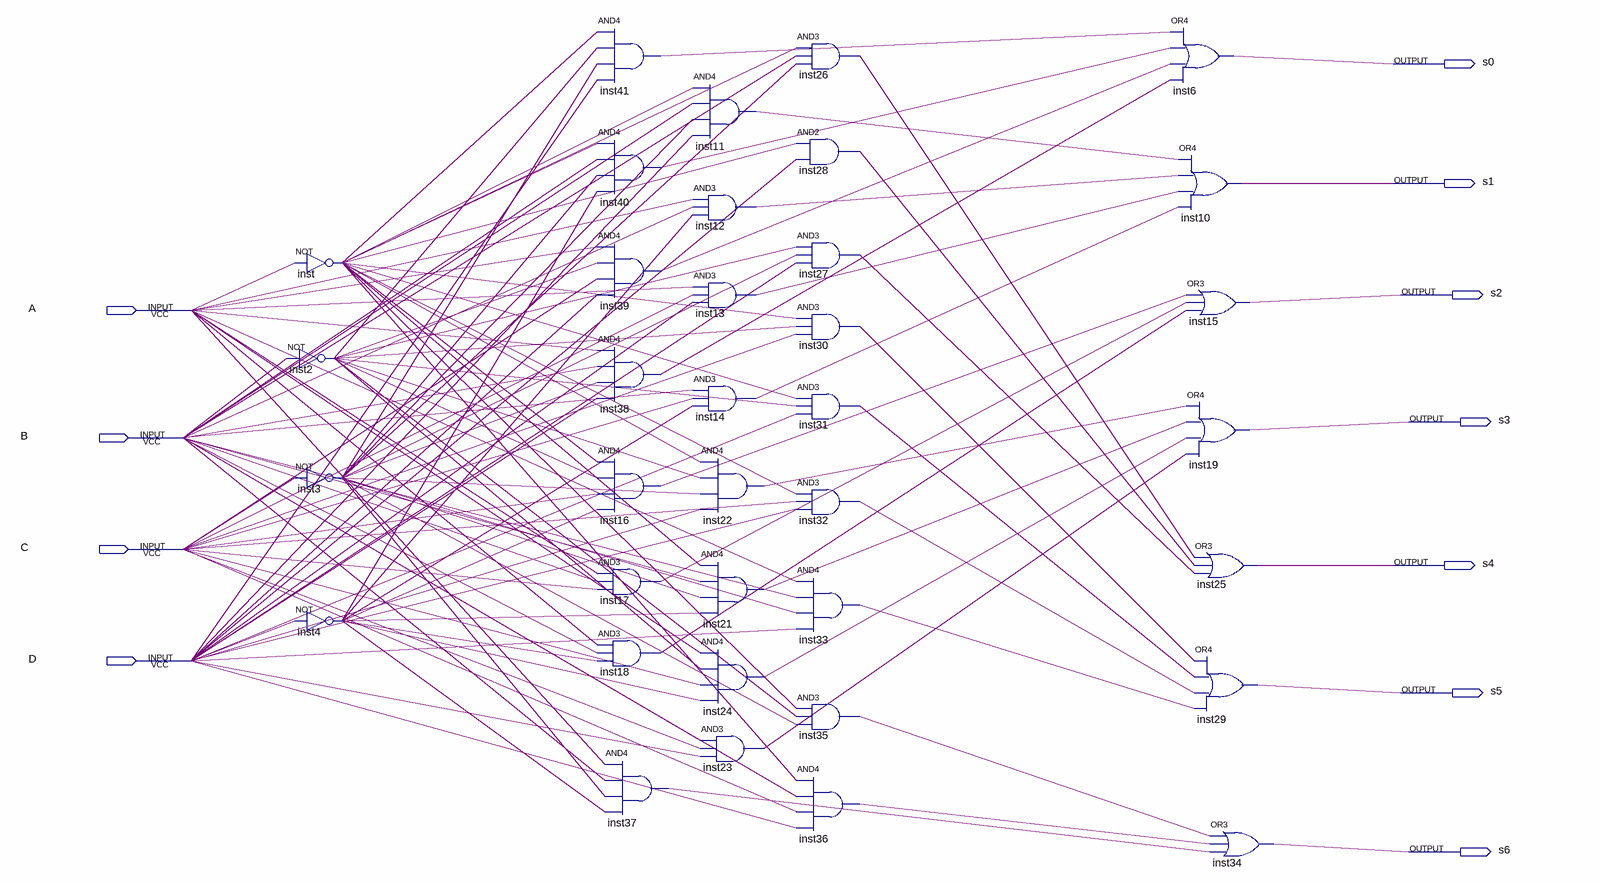
[diagram p0: schematic sheet]
// Quartus schematic display.bdf as structural Verilog: 36 symbols, 11 pins
module display (
  input  A,
  input  B,
  input  C,
  input  D,
  output s0,
  output s1,
  output s2,
  output s3,
  output s4,
  output s5,
  output s6
);

  wire inst2_out, inst3_out, inst4_out, inst11_out, inst12_out, inst13_out, inst14_out, inst16_out,
       inst17_out, inst18_out, inst21_out, inst22_out, inst23_out, inst24_out, inst26_out, inst27_out,
       inst28_out, inst30_out, inst31_out, inst32_out, inst33_out, inst35_out, inst36_out, inst37_out,
       inst38_out, inst39_out, inst40_out, inst41_out, inst_out;

  not inst (inst_out, A);
  not inst2 (inst2_out, B);
  not inst3 (inst3_out, C);
  not inst4 (inst4_out, D);
  and inst41 (inst41_out, inst_out, inst2_out, inst3_out, D);
  and inst40 (inst40_out, inst_out, B, inst3_out, inst4_out);
  and inst39 (inst39_out, A, inst2_out, C, D);
  and inst38 (inst38_out, A, B, inst3_out, D);
  and inst16 (inst16_out, inst_out, inst2_out, C, inst4_out);
  and inst17 (inst17_out, A, B, C);
  and inst18 (inst18_out, A, B, inst4_out);
  and inst37 (inst37_out, A, B, inst3_out, inst4_out);
  and inst11 (inst11_out, inst_out, B, inst3_out, D);
  and inst12 (inst12_out, A, B, inst4_out);
  and inst13 (inst13_out, A, C, D);
  and inst14 (inst14_out, B, C, inst4_out);
  and inst22 (inst22_out, inst_out, inst2_out, inst3_out, D);
  and inst21 (inst21_out, inst_out, B, inst3_out, inst4_out);
  and inst24 (inst24_out, A, inst2_out, C, inst4_out);
  and inst23 (inst23_out, B, C, D);
  and inst26 (inst26_out, inst_out, B, inst3_out);
  and inst28 (inst28_out, inst_out, D);
  and inst27 (inst27_out, inst2_out, inst3_out, D);
  and inst30 (inst30_out, inst_out, inst2_out, C);
  and inst31 (inst31_out, inst_out, inst2_out, D);
  and inst32 (inst32_out, inst_out, C, D);
  and inst33 (inst33_out, A, B, inst3_out, D);
  and inst35 (inst35_out, inst_out, inst2_out, inst3_out);
  and inst36 (inst36_out, inst_out, B, C, D);
  or inst6 (s0, inst41_out, inst40_out, inst39_out, inst38_out);
  or inst10 (s1, inst11_out, inst12_out, inst13_out, inst14_out);
  or inst15 (s2, inst16_out, inst17_out, inst18_out);
  or inst19 (s3, inst22_out, inst21_out, inst24_out, inst23_out);
  or inst25 (s4, inst26_out, inst28_out, inst27_out);
  or inst29 (s5, inst30_out, inst31_out, inst32_out, inst33_out);
  or inst34 (s6, inst35_out, inst36_out, inst37_out);
endmodule
